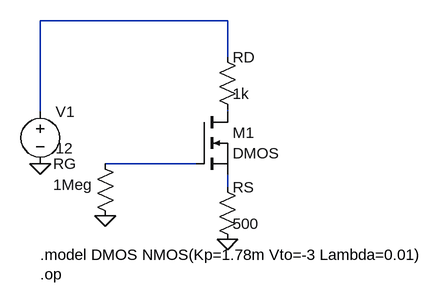
[diagram p0: schematic Ex06.asc]
Ex06.asc, the LTspice schematic file:
Version 4
SHEET 1 880 680
WIRE 80 200 80 60
WIRE 80 60 368 60
WIRE 368 60 368 116
WIRE 368 196 368 200
WIRE 368 296 368 316
WIRE 180 280 320 280
FLAG 80 280 0
FLAG 180 360 0
FLAG 368 396 0
SYMBOL voltage 80 184 R0
WINDOW 0 24 16 Left 2
WINDOW 3 24 72 Left 2
SYMATTR InstName V1
SYMATTR Value 12
SYMBOL res 164 264 R0
WINDOW 0 -64 16 Left 2
WINDOW 3 -64 48 Left 2
SYMATTR InstName RG
SYMATTR Value 1Meg
SYMBOL res 352 100 R0
WINDOW 0 24 16 Left 2
WINDOW 3 24 72 Left 2
SYMATTR InstName RD
SYMATTR Value 1k
SYMBOL nmos 320 200 R0
WINDOW 0 56 32 Left 2
WINDOW 3 56 64 Left 2
SYMATTR InstName M1
SYMATTR Value DMOS
SYMBOL res 352 300 R0
WINDOW 0 24 16 Left 2
WINDOW 3 24 72 Left 2
SYMATTR InstName RS
SYMATTR Value 500
TEXT 80 420 Left 2 !.model DMOS NMOS(Kp=1.78m Vto=-3 Lambda=0.01)
TEXT 80 450 Left 2 !.op

The netlist it stands for:
* Ex06.asc
V1 N001 0 12
RG N004 0 1Meg
RD N001 N002 1k
M1 N002 N004 N003 N003 DMOS
RS N003 0 500
.model NMOS NMOS
.model PMOS PMOS
.lib standard.mos
.model DMOS NMOS(Kp=1.78m Vto=-3 Lambda=0.01)
.op
.backanno
.end